# Altium schematic sheet minimal.SchDoc: Import fixture
size A4
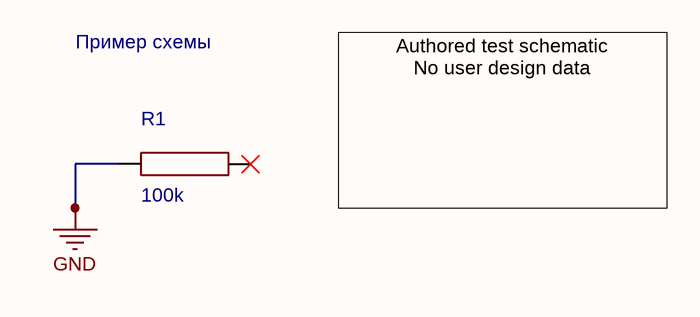
[diagram p0: minimal.SchDoc]

## Parts
R1  100k

## Nets
GND: R1.1

Not connected (* = marked no-connect by the designer): R1 2*

## Notes on the sheet
- Пример схемы
- Authored test schematic
  No user design data

## Library data of the parts
R1 = Resistor